# Altium project Oil-Diffuser-A-v1.0.0.PrjPcb
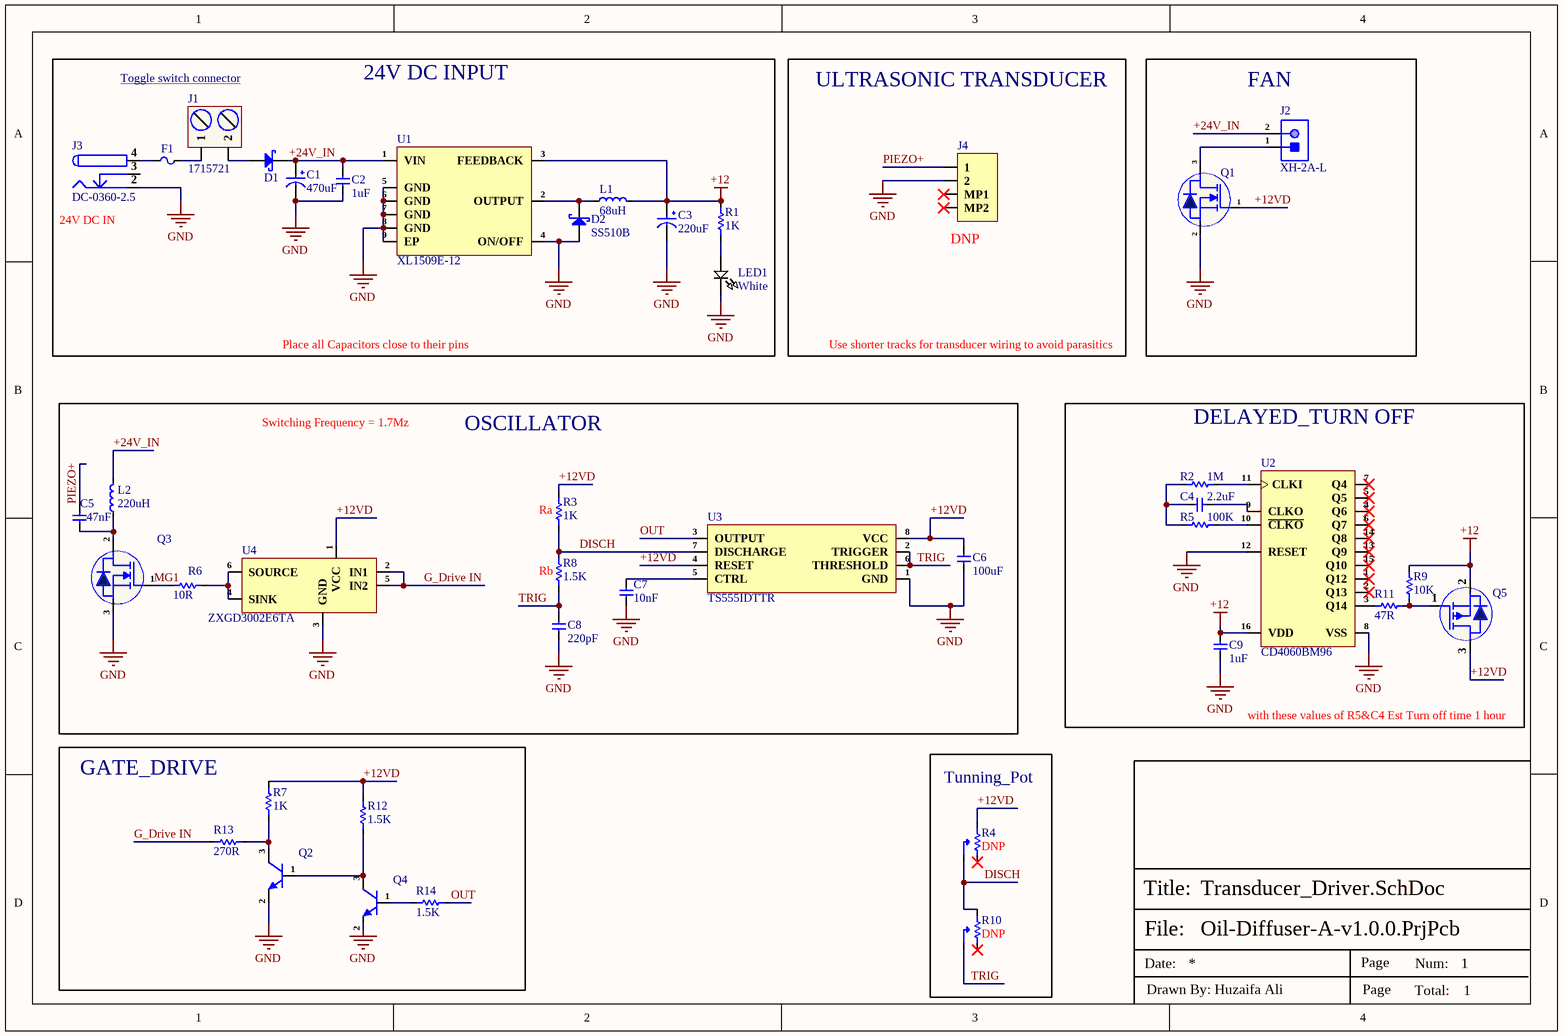
[diagram p0: Transducer_Driver.SchDoc]
1 sheet, 42 parts. Net scope: global (net labels, ports and power ports of the same name join across sheets).
Board file: PCB-Oil Diffuser.PcbDoc

## Sheet Transducer_Driver.SchDoc
size A4; SheetNumber: 1; SheetTotal: 1

### Parts
C1  470uF  [189RV0027]
C2  1uF  [Cap-0603]
C3  220uF  [189RV0019]
C4  2.2uF  [CAP-0603]
C5  47nF  [CFA2J473JC4PK5136A00]
C6  100uF  [Cap-1210]
C7  10nF  [Cap-0603]
C8  220pF  [CD1H221JC9BECHE100]
C9  1uF  [Cap-0603]
D1  SS510B  [SMB_]  (value not drawn)
D2  SS510B  [SMB_]
F1  BSMD1812-150-33V  [Fuse-1812_]  (value not drawn)
J1  1715721  [1715721]
J2  XH-2A-L  [XH-2A-L]
J3  DC-0360-2.5  [DC-0360-2.5]
J4  DNP  [WAFER-PH2.0-2PWB]
L1  68uH  [PSPMAA0605H-680M-IGF]
L2  220uH  [PK0810-221MB]
LED1  White  [LED-0603]
Q1  AO3400A  [sot-23]  (value not drawn)
Q2  ZXTN2040FTA  [SOT-23]  (value not drawn)
Q3  STD12N10L-VB  [TO-252-2L]  (value not drawn)
Q4  ZXTN2040FTA  [SOT-23]  (value not drawn)
Q5  G7P03L  [SOT-23-3L_]  (value not drawn)
R1  1K  [RES-0805]
R2  1M  [Res-0603]
R3  1K  [Plugin,D2.3xL6.5mm]
R4  DNP  [3296W-1-502]
R5  100K  [RES-0805]
R6  10R  [RES-2010]
R7  1K  [Res-1206]
R8  1.5K  [Plugin,D2.3xL6.5mm]
R9  10K  [Res-0603]
R10  DNP  [3296W-1-502]
R11  47R  [Res-0603]
R12  1.5K  [Res-0603]
R13  270R  [Res-0603]
R14  1.5K  [Res-0603]
U1  XL1509E-12  [ESOP-8]
U2  CD4060BM96  [16-SOIC (0.154", 3.90mm Width)]
U3  TS555IDTTR  [SOIC-8(0.154", 3.90mm Width)]
U4  ZXGD3002E6TA  [SOT-23-6]

### Blocks framed on the sheet
24V DC INPUT: C1-C3 D1 D2 F1 J1 J3 L1 LED1 R1 U1
ULTRASONIC TRANSDUCER: J4
FAN: J2 Q1
OSCILLATOR: C5-C8 L2 Q3 R3 R6 R8 U3 U4
DELAYED_TURN OFF: C4 C9 Q5 R2 R5 R9 R11 U2
GATE_DRIVE: Q2 Q4 R7 R12-R14
Tunning_Pot: R4 R10

### Nets
+12: C3.1 C9.2 L1.2 Q5.2(S) R1.2 R9.2 U1.3(FEEDBACK) U2.16(VDD)
GND: C1.2 C2.1 C3.2 C6.1 C7.1 C8.1 C9.1 D2.1(A) J3.2 J4.2 LED1.2 Q1.2(S) Q2.2(E) Q3.3(S) Q4.2(E) U1.4(ON/OFF) U1.5(GND) U1.6(GND) U1.7(GND) U1.8(GND) U1.9(EP) U2.8(VSS) U2.12(RESET) U3.1(GND) U4.3(GND)
+12VD: C6.2 Q1.1(G) Q5.3(D) R3.2 R4.3(CW) R7.2 R12.2 U3.4(RESET) U3.8(VCC) U4.1(VCC)
+24V_IN: C1.1 C2.2 D1.2(K) J2.2 L2.2 U1.1(VIN)
DISCH: R3.1 R4.2(Wiper) R8.2 R10.3(CW) U3.7(DISCHARGE)
G_Drive IN: R13.1 U4.2(IN1) U4.5(IN2)
MG1: Q3.1(G) R6.1
OUT: R14.1 U3.3(OUTPUT)
PIEZO+: C5.1 J4.1
TRIG: C8.2 R8.1 R10.2(Wiper) U3.2(TRIGGER) U3.6(THRESHOLD)
NetC4_1: C4.1 R2.1 R5.1
NetC4_2: C4.2 U2.9(CLKO)
NetC5_2: C5.2 L2.1 Q3.2(D)
NetC7_2: C7.2 U3.5(CTRL)
NetD1_1: D1.1(A) J1.2
NetD2_2: D2.2(K) L1.1 U1.2(OUTPUT)
NetF1_1: F1.1 J3.4
NetF1_2: F1.2 J1.1
NetJ2_1: J2.1 Q1.3(D)
NetLED1_1: LED1.1 R1.1
NetQ2_1: Q2.1(B) Q4.3(C) R12.1
NetQ2_3: Q2.3(C) R7.1 R13.2
NetQ4_1: Q4.1(B) R14.2
NetQ5_1: Q5.1(G) R9.1 R11.2
NetR2_2: R2.2 U2.11(CLKI)
NetR5_2: R5.2 U2.10(~{CLKO})
NetR6_2: R6.2 U4.4(SINK) U4.6(SOURCE)
NetR11_1: R11.1 U2.3(Q14)

Not connected (* = marked no-connect by the designer): J3 3; J4 MP1* MP2*; R4 1(CCW)*; R10 1(CCW)*; U2 1(Q12)* 2(Q13)* 4(Q6)* 5(Q5)* 6(Q7)* 7(Q4)* 13(Q9)* 14(Q8)* 15(Q10)*

### Notes on the sheet
- Toggle switch connector <https://www.amazon.com/Gardner-Bender-GSW-18-Heavy-Duty-Electrical/dp/B00004WLKC/ref=asc_df_B00004WLKC/>
- (near J3) 24V DC IN
- Place all Capacitors close to their pins
- Use shorter tracks for transducer wiring to avoid parasitics
- Switching Frequency = 1.7Mz
- (near R3) Ra
- (near R8) Rb
- with these values of R5&C4 Est Turn off time 1 hour
- File:
- Title:
- Date:
- Page
- Num:
- Total:
- Drawn By: Huzaifa Ali

### Library data of the parts
C1 = 189RV0027: 470uF 35V 850mA@100KHz 80mΩ@100KHz ±20% SMD,D8xL10.5mm Aluminum Electrolytic Capacitors - SMD ROHS; Manufacturer: KNSCHA; Manufacturer Part Number: 189RV0027; Package: SMD,D8xL10.5mm; LCSC Part Number: C7471889; Item Type: Capacitors; ComponentLink1Description: LCSC; ComponentLink1URL: https://www.lcsc.com/product-detail/Aluminum-Electrolytic-Capacitors-SMD_KNSCHA-189RV0027_C7471889.html
C2 C9 = TCC0603X5R105M250CT: 1uF 25V X5R ±20% 0603 Multilayer Ceramic Capacitors MLCC - SMD/SMT ROHS; Manufacturer: CCTC; LCSC Part Number: C6266891; Manufacturer Part Number: TCC0603X5R105M250CT; Value: 1uF; Item Type: Capacitor; ComponentLink1Description: LCSC; ComponentLink1URL: https://www.lcsc.com/product-detail/Multilayer-Ceramic-Capacitors-MLCC-SMD-SMT_CCTC-TCC0603X5R105M250CT_C6266891.html
C3 = 189RV0019: 220uF 35V 600mA@100KHz 160mΩ@100KHz ±20% SMD,D6.3xL7.7mm Aluminum Electrolytic Capacitors - SMD ROHS; Manufacturer: KNSCHA; Manufacturer Part Number: 189RV0019; Package: SMD,D6.3xL7.7mm; LCSC Part Number: C7471881; Item Type: Capacitors; ComponentLink1Description: LCSC; ComponentLink1URL: https://www.lcsc.com/product-detail/Aluminum-Electrolytic-Capacitors-SMD_KNSCHA-189RV0019_C7471881.html
C4 = CC0603KRX5R8BB225: CAP CER 2.2UF 25V X5R 0603; Manufacturer: Yageo; Tolerance: 10%; Item Type: Capacitor; Supplier 1: Digi-Key; Manufacturer Part Number: CC0603KRX5R8BB225; Stock 1: 687936; Pricing 1: 1=0.4, 10=0.276, 50=0.1932, 100=0.1656, 500=0.1242, 1000=0.10488 (USD); Mount: Surface Mount; Case/Package: 0603; Case Code (Metric): 1608; Case Code (Imperial): 0603; Weight: 7.1E-05oz; Min Operating Temperature: -55°C; Max Operating Temperature: 85°C; Packaging: Tape and Reel; Capacitance: 2.2uF; Dielectric: X5R; Voltage Rating: 25V; Termination: SMD/SMT; Resistor Type: Ceramic; Voltage Rating (DC): 25V; Package Quantity: 4000; Length: 1.6mm; Width: 0.031inch; Thickness: 0.037inch; Depth: 0.8mm; Radiation Hardening: No; Lead Free: Lead Free; Halogen Free: Halogen Free; RoHS Compliant: Yes; ComponentLink1URL: https://www.verical.com/server-webapp/html/getDatasheet?partID=782757&src-supplier=Verical; ComponentLink1Description: https://www.verical.com/server-webapp/html/getDatasheet?partID=782757&src-supplier=Verical; Supplier Part Number 1: 311-1786-1-ND; LCSC Part Number: C309478
C5 = CFA2J473JC4PK5136A00: 5% 630V 47nF Plugin,P=5.08mm Film Capacitors ROHS; Manufacturer: Dersonic; Manufacturer Part Number: CFA2J473JC4PK5136A00; Package: Plugin,P=5.08mm; LCSC Part Number: C20754717; Item Type: Capacitor; ComponentLink1Description: LCSC; ComponentLink1URL: https://www.lcsc.com/product-detail/Film-Capacitors_Dersonic-CFA2J473JC4PK5136A00_C20754717.html
C6 = EMK325ABJ107MM-P: CAP CER 100UF 16V X5R 1210; Manufacturer: Taiyo Yuden; Tolerance: 20%; Item Type: Capacitor; Supplier 1: Digi-Key; Manufacturer Part Number: EMK325ABJ107MM-P; RoHS: Yes; Category: Ceramic Capacitors; Stock 1: 81344; Pricing 1: 1=1.75, 10=1.415, 50=1.2352, 100=1.0809, 500=0.82352 (USD); Mounting Technology: Surface Mount; Case/Package: 1210; Case Code (Imperial): 1210; Case Code (Metric): 3225; Min Operating Temperature: -55°C; Max Operating Temperature: 85°C; Packaging: Cut Tape; Value: 100uF; Voltage Rating: 16V; Series: M; Lead Free: Lead Free; RoHS Compliant: Yes; ComponentLink1URL: http://ds.yuden.co.jp/TYCOMPAS/ut/detail.do?productNo=EMK325ABJ107MM-P&fileName=EMK325ABJ107MM-P_SS&mode=specSheetDownload&src-supplier=Digi-Key; ComponentLink1Description: http://ds.yuden.co.jp/TYCOMPAS/ut/detail.do?productNo=EMK325ABJ107MM-P&fileName=EMK325ABJ107MM-P_SS&mode=specSheetDownload&src-supplier=Digi-Key; Supplier Part Number 1: 587-5426-1-ND; LCSC Part Number: C90143
C7 = GCM188R91H103KA37D: CAP CER 10000PF 50V X8R 0603; Item Type: Capacitor; Tolerance: 10%; LCSC Part Number: C710687; ComponentLink1Description: LCSC; Supplier: Avnet; Supplier Part Number: GCM188R91H103KA37D; RoHS: Yes; Category: Ceramic Capacitors; Stock: 20000; Pricing: 4000=0.01955, 8000=0.01909, 16000=0.01863, 24000=0.01817, 32000=0.01771 (USD); Case/Package: 0603; Min Operating Temperature: -55°C; Max Operating Temperature: 150°C; Value: 10nF; Series: GCM; Voltage Rating: 50V; Ratings: AEC-Q200; Lead Free: Lead Free; RoHS Compliant: Yes; ComponentLink2URL: http://search.murata.co.jp/Ceramy/image/img/A01X/partnumbering_e_02.pdf?src-supplier=Digi-Key; ComponentLink2Description: http://search.murata.co.jp/Ceramy/image/img/A01X/partnumbering_e_02.pdf?src-supplier=Digi-Key
C8 = CD1H221JC9BECHE100: ±5% 50V 220pF NP0 Plugin,P=5.08mm Multilayer Ceramic Capacitors MLCC - Leaded ROHS; Manufacturer: Dersonic; Manufacturer Part Number: CD1H221JC9BECHE100; Package: Plugin,P=5.08mm; LCSC Part Number: C2761745; Item Type: Capacitors; ComponentLink1Description: LCSC; ComponentLink1URL: https://www.lcsc.com/product-detail/Multilayer-Ceramic-Capacitors-MLCC-Leaded_Dersonic-CD1H221JC9BECHE100_C2761745.html
D1 D2 = SS510B: SCHOTTKY DIODE SMB 100V 5A; Manufacturer: MDD; Manufacturer Part Number: SS510B; Package: SMB; ComponentLink1Description: LCSC; ComponentLink1URL: https://www.lcsc.com/product-detail/Schottky-Barrier-Diodes-SBD_JUXING-SS510B_C3011128.html; LCSC Part Number: C3011128; Item Type: Diode
F1 = BSMD1812-150-33V: 33V 1.5A 40A 3A 1812 Resettable Fuses ROHS; Manufacturer: BHFUSE; Item Type: Fuse; Manufacturer Part Number: BSMD1812-150-33V; Package: 1812; LCSC Part Number: C883154; ComponentLink1Description: LCSC; ComponentLink1URL: https://www.lcsc.com/product-detail/Resettable-Fuses_BHFUSE-BSMD1812-150-33V_C883154.html
J1 = 1715721: TERM BLK 2P SIDE ENT 5.08MM PCB; Manufacturer: Phoenix Contact; Item Type: Terminal Blocks; Supplier: Digikey; LCSC Part Number: C480516; Manufacturer Part Number: 1715721; RoHS: Yes; Stock: 13160; Pricing: 1=0.94 (USD); ComponentLink1URL: https://datasheet.ciiva.com/1120/1697161-1120393.pdf?src-supplier=Farnell; ComponentLink1Description: https://datasheet.ciiva.com/1120/1697161-1120393.pdf?src-supplier=Farnell; ComponentLink2URL: https://datasheet.ciiva.com/832/1715721-832095.pdf?src-supplier=Digikey; ComponentLink2Description: https://datasheet.ciiva.com/832/1715721-832095.pdf?src-supplier=Digikey; ComponentLink3URL: https://datasheet.ciiva.com/15169/getdatasheetpartid-212174-15169929.pdf?src-supplier=Verical; ComponentLink3Description: https://datasheet.ciiva.com/15169/getdatasheetpartid-212174-15169929.pdf?src-supplier=Verical; ComponentLink4URL: https://datasheet.ciiva.com/16046/1715721-16046034.pdf?src-supplier=Onlinecomponents.com; ComponentLink4Description: https://datasheet.ciiva.com/16046/1715721-16046034.pdf?src-supplier=Onlinecomponents.com
J2 = XH-2A-L: 1x2P 2P XH 1 Tin 2.5mm 2 -25℃~+85℃ Brass 3A Straight Plugin,P=2.5mm Wire To Board Connector ROHS; Manufacturer: HCTL; Manufacturer Part Number: XH-2A-L; Package: Plugin,P=2.5mm; LCSC Part Number: C2908597; Item Type: Wire To Board Connector; ComponentLink1Description: LCSC; ComponentLink1URL: https://www.lcsc.com/product-detail/Wire-To-Board-Connector_HCTL-XH-2A-L_C2908597.html
J3 = DC-0360-2.5: DC Power Receptacle 260℃ Brass -20℃~+70℃ 2.5mm 6mm 2.5A 24V Plugin AC/DC Power Connectors ROHS; Manufacturer: XKB Connectivity; Item Type: DC Jack; Manufacturer Part Number: DC-0360-2.5; Package: Plugin; LCSC Part Number: C319122; ComponentLink1Description: LCSC; ComponentLink1URL: https://www.lcsc.com/product-detail/AC-DC-Power-Connectors_XKB-Connectivity-DC-0360-2-5_C319122.html
J4 = WAFER-PH2.0-2PWB: 1x2P 1 2mm Male pin 2 -25℃~+85℃ 2A Surface Mount SMD,P=2mm Wire To Board / Wire To Wire Connector ROHS; Manufacturer: XUNPU; Item Type: Right Angle JST; Manufacturer Part Number: WAFER-PH2.0-2PWB; Package: SMD,P=2mm; LCSC Part Number: C3029440; ComponentLink1Description: LCSC; ComponentLink1URL: https://www.lcsc.com/product-detail/Wire-To-Board-Wire-To-Wire-Connector_XUNPU-WAFER-PH2-0-2PWB_C3029440.html
L1 = PSPMAA0605H-680M-IGF: 2A 68uH ±20% 2.5A SMD,6.6x7.1mm Power Inductors ROHS; Manufacturer: PROD Tech; Manufacturer Part Number: PSPMAA0605H-680M-IGF; Package: SMD,6.6x7.1mm; LCSC Part Number: C2983094; Item Type: Inductor; ComponentLink1Description: LCSC; ComponentLink1URL: https://www.lcsc.com/product-detail/Power-Inductors_PROD-Tech-PSPMAA0605H-680M-IGF_C2983094.html
L2 = PK0810-221MB: 600mA 220uH EI-core Inductor ±20% Plugin Power Inductors ROHS; Manufacturer: SXN; Manufacturer Part Number: PK0810-221MB; Package: Plugin; LCSC Part Number: C400317; Item Type: Inductor; ComponentLink1Description: LCSC; ComponentLink1URL: https://www.lcsc.com/product-detail/Power-Inductors_SXN-Shun-Xiang-Nuo-Elec-PK0810-221MB_C400317.html
LED1 = NCD0603W3: White light 0603 Light Emitting Diodes (LED) ROHS; Manufacturer: Foshan NationStar Optoelectronics; Manufacturer Part Number: NCD0603W3; Package: 0603; LCSC Part Number: C158100; Item Type: LED; ComponentLink1Description: LCSC; ComponentLink1URL: https://www.lcsc.com/product-detail/Light-Emitting-Diodes-LED_Foshan-NationStar-Optoelectronics-NCD0603W3_C158100.html
Q1 = AO3400A: 30V 5.8A 32mΩ@10V,5.8A 1.4W 1.4V@250uA N Channel SOT-23 MOSFETs ROHS; Manufacturer: BORN; Item Type: Mosfet; ComponentLink1Description: LCSC; ComponentLink1URL: https://www.lcsc.com/product-detail/MOSFETs_BORN-AO3400A_C344010.html; Manufacturer Part Number: AO3400A; Footprint: SOT-23; LCSC Part Number: C344010
Q2 Q4 = ZXTN2040FTA: TRANS NPN 40V 1A SOT23-3; Manufacturer: Diodes Zetex; Item Type: BJTs; Supplier: Digikey; LCSC Part Number: C460141; Manufacturer Part Number: ZXTN2040FTA; RoHS: Yes; Stock: 9989; Pricing: 1=0.38, 10=0.258, 100=0.1744, 500=0.13526, 1000=0.12224 (USD); ComponentLink1URL: https://datasheet.ciiva.com/973/zxtn2040f-973922.pdf?src-supplier=Digikey; ComponentLink1Description: https://datasheet.ciiva.com/973/zxtn2040f-973922.pdf?src-supplier=Digikey; ComponentLink2URL: https://datasheet.ciiva.com/17037/0900766b80d2efd3-17037010.pdf?src-supplier=Allied+Electronics; ComponentLink2Description: https://datasheet.ciiva.com/17037/0900766b80d2efd3-17037010.pdf?src-supplier=Allied+Electronics; ComponentLink3URL: https://datasheet.ciiva.com/15139/getdatasheetpartid-76608-15139038.pdf?src-supplier=Verical; ComponentLink3Description: https://datasheet.ciiva.com/15139/getdatasheetpartid-76608-15139038.pdf?src-supplier=Verical; ComponentLink4URL: https://datasheet.ciiva.com/973/zxtn2040f-973923.pdf?src-supplier=Digikey; ComponentLink4Description: https://datasheet.ciiva.com/973/zxtn2040f-973923.pdf?src-supplier=Digikey; ComponentLink5URL: https://datasheet.ciiva.com/973/zxtn2040f-973924.pdf?src-supplier=Digikey; ComponentLink5Description: https://datasheet.ciiva.com/973/zxtn2040f-973924.pdf?src-supplier=Digikey; ComponentLink6URL: https://datasheet.ciiva.com/11201/zxtn2040f-11201581.pdf?src-supplier=Avnet; ComponentLink6Description: https://datasheet.ciiva.com/11201/zxtn2040f-11201581.pdf?src-supplier=Avnet; ComponentLink7URL: https://datasheet.ciiva.com/11206/zxtn2040f-11206668.pdf?src-supplier=Avnet; ComponentLink7Description: https://datasheet.ciiva.com/11206/zxtn2040f-11206668.pdf?src-supplier=Avnet; ComponentLink8URL: https://datasheet.ciiva.com/16508/zxtn2040f-16508997.pdf?src-supplier=Future+Electronics; ComponentLink8Description: https://datasheet.ciiva.com/16508/zxtn2040f-16508997.pdf?src-supplier=Future+Electronics
Q3 = STD12N10L-VB: 100V 15A 96W 114mΩ@10V,3A 3.5V@250uA 1 N-Channel TO-252 MOSFETs ROHS; Manufacturer: VBsemi; Manufacturer Part Number: STD12N10L-VB; Package: TO-252; LCSC Part Number: C5179533; Item Type: MOSFETs; ComponentLink1Description: LCSC; ComponentLink1URL: https://www.lcsc.com/product-detail/MOSFETs_VBsemi-Elec-STD12N10L-VB_C5179533.html
Q5 = G7P03L: 30V 7A 19mΩ 1.9W 1.1V@250uA P Channel SOT-23-3L MOSFETs ROHS; Manufacturer: GoFord; Item Type: Mosfet; Supplier 1: Digi-Key; Manufacturer Part Number: G7P03L; RoHS: No; Category: Uncategorized; Stock 1: 6672; Pricing 1: 1=0.45000, 10=0.36500, 100=0.24860, 500=0.18648, 1000=0.13986 (USD); LCSC Part Number: C840062; ComponentLink1Description: LCSC; ComponentLink1URL: https://www.lcsc.com/product-detail/MOSFETs_GOFORD-G7P03L_C840062.html
R1 = RC0805FR-071KL: RES 1K OHM 1% 1/8W 0805; Manufacturer: Yageo; Value: 1kR; Voltage Rating (DC): 150V; Temperature Coefficient: 100ppm/°C; Power Rating: 125mW; Item Type: Resistor; Supplier: Future Electronics; Supplier Part Number: 8126013; Manufacturer Part Number: RC0805FR-071KL; RoHS: Yes; Category: Chip SMD Resistors; Stock: 8305000; Pricing: 5000=0.117, 25000=0.112, 125000=0.107, 500000=0.104, 1250000=0.0981 (USD); Case/Package: 0805; Pins: 2; Case Code (Metric): 2012; Case Code (Imperial): 0805; Min Operating Temperature: -55°C; Max Operating Temperature: 155°C; Tolerance: 1%; Packaging: Tape and Reel; Resistor Type: Thick Film; Package Quantity: 1; Voltage Rating: 150V; Termination: SMD/SMT; Series: RC; Number of Terminations: 2; Max Power Dissipation: 125mW; Features: Moisture Resistant; Resistance Tolerance: 1%; Construction: Rectangular; Voltage Rating (AC): 150V; Length: 0.079inch; Width: 0.049inch; Height: 0.024inch; Depth: 1.25mm; Reach SVHC Compliant: No; Lead Free: 5697LeadFree; RoHS Compliant: Yes; Military Standard: Not; ComponentLink1URL: https://datasheet.ciiva.com/7941/1686128-7941719.pdf?src-supplier=Element14; ComponentLink1Description: https://datasheet.ciiva.com/7941/1686128-7941719.pdf?src-supplier=Element14; ComponentLink2URL: https://datasheet.ciiva.com/46385/444164-46385020.pdf?src-supplier=Element14; ComponentLink2Description: https://datasheet.ciiva.com/46385/444164-46385020.pdf?src-supplier=Element14; ComponentLink3URL: https://datasheet.ciiva.com/2456/pyu-r-int-thick-7-2456976.pdf?src-supplier=Digi-Key; ComponentLink3Description: https://datasheet.ciiva.com/2456/pyu-r-int-thick-7-2456976.pdf?src-supplier=Digi-Key; ComponentLink4URL: https://datasheet.ciiva.com/2456/pyu-r-int-thick-7-2456977.pdf?src-supplier=Digi-Key; ComponentLink4Description: https://datasheet.ciiva.com/2456/pyu-r-int-thick-7-2456977.pdf?src-supplier=Digi-Key; ComponentLink5URL: https://datasheet.ciiva.com/2456/pyu-r-int-thick-7-2456975.pdf?src-supplier=Digi-Key; ComponentLink5Description: https://datasheet.ciiva.com/2456/pyu-r-int-thick-7-2456975.pdf?src-supplier=Digi-Key; ComponentLink6URL: https://datasheet.ciiva.com/16850/rc0805-16850409.pdf?src-supplier=Future+Electronics; ComponentLink6Description: https://datasheet.ciiva.com/16850/rc0805-16850409.pdf?src-supplier=Future+Electronics; LCSC Part Number: C95781
R2 = CRCW06031M00FKEA: RES SMD 1M OHM 1% 1/10W 0603; Manufacturer: Vishay; Item Type: Resistors; Value: 1MR; Temperature Coefficient: 100ppm/°C; Power Rating: 100mW; Voltage Rating: 75V; Supplier: Digikey; LCSC Part Number: C844922; Manufacturer Part Number: CRCW06031M00FKEA; RoHS: Yes; Stock: 380955; Pricing: 1=0.1, 10=0.027, 50=0.0166, 100=0.0138, 500=0.00934, 1000=0.00802 (USD); Case/Package: 0603; Pins: 2; Contact Plating: Tin; Weight: 7.1E-05oz; Case Code (Imperial): 0603; Case Code (Metric): 1608; Min Operating Temperature: -55°C; Max Operating Temperature: 155°C; Tolerance: 1%; Packaging: Tape and Reel; Resistor Type: Thick Film; Package Quantity: 10; Termination: SMD/SMT; Series: CRCW; Number of Terminations: 2; Max Power Dissipation: 100mW; Features: Automotive AEC-Q200; Technology: THICK FILM; Voltage Rating (DC): 75V; Construction: Rectangular; Resistance Tolerance: 1%; Length: 1.55mm; Width: 0.033inch; Height: 0.45mm; Depth: 0.85mm; Radiation Hardening: No; RoHS Compliant: Yes; Lead Free: 5697LeadFree; Reach SVHC Compliant: Unknown; Military Standard: Not; ComponentLink1URL: https://datasheet.ciiva.com/11809/0900766b80d98afc-11809074.pdf?src-supplier=Rs; ComponentLink1Description: https://datasheet.ciiva.com/11809/0900766b80d98afc-11809074.pdf?src-supplier=Rs; ComponentLink2URL: https://datasheet.ciiva.com/7841/125364-7841823.pdf?src-supplier=Element14; ComponentLink2Description: https://datasheet.ciiva.com/7841/125364-7841823.pdf?src-supplier=Element14; ComponentLink3URL: https://datasheet.ciiva.com/7841/1720486-7841822.pdf?src-supplier=Element14; ComponentLink3Description: https://datasheet.ciiva.com/7841/1720486-7841822.pdf?src-supplier=Element14; ComponentLink4URL: https://datasheet.ciiva.com/26314/fld-crcw-e3-data-en-26314645.pdf?src-supplier=Distrelec; ComponentLink4Description: https://datasheet.ciiva.com/26314/fld-crcw-e3-data-en-26314645.pdf?src-supplier=Distrelec; ComponentLink5URL: https://datasheet.ciiva.com/2465/dcrcwe3-2465550.pdf?src-supplier=Digikey; ComponentLink5Description: https://datasheet.ciiva.com/2465/dcrcwe3-2465550.pdf?src-supplier=Digikey; ComponentLink6URL: https://datasheet.ciiva.com/2465/dcrcwe3-2465551.pdf?src-supplier=Digikey; ComponentLink6Description: https://datasheet.ciiva.com/2465/dcrcwe3-2465551.pdf?src-supplier=Digikey; ComponentLink7URL: https://datasheet.ciiva.com/2465/dcrcwe3-2465549.pdf?src-supplier=Digikey; ComponentLink7Description: https://datasheet.ciiva.com/2465/dcrcwe3-2465549.pdf?src-supplier=Digikey; ComponentLink8URL: https://datasheet.ciiva.com/16311/dcrcwe3-16311533.pdf?src-supplier=Future+Electronics; ComponentLink8Description: https://datasheet.ciiva.com/16311/dcrcwe3-16311533.pdf?src-supplier=Future+Electronics
R3 = MF14W 1KR: Metal Film Resistors 1kΩ 250mW ±200ppm/℃ ±1% Plugin,D2.3xL6.5mm Through Hole Resistors ROHS; Manufacturer: Huaxing Mechanical-Elec; Manufacturer Part Number: MF1/4W-1KΩ±1%T52; Package: Plugin,D2.3xL6.5mm; LCSC Part Number: C713997; Item Type: Resistors; ComponentLink1Description: LCSC; ComponentLink1URL: https://www.lcsc.com/product-detail/Through-Hole-Resistors_Huaxing-Mechanical-Elec-MF1-4W-1K-1-T52_C713997.html
R4 R10 = 3296W-1-502: 10% 5kΩ Plugin Potentiometers, Variable Resistors ROHS; Manufacturer: BOCHEN; Manufacturer Part Number: 3296W-1-502; LCSC Part Number: C118907; Item Type: Potentiometer; ComponentLink1Description: LCSC; ComponentLink1URL: https://www.lcsc.com/product-detail/Potentiometers-Variable-Resistors_BOCHEN-Chengdu-Guosheng-Tech-3296W-1-502_C118907.html
R5 = RC0805FR-07100KL: RES 100K OHM 1% 1/8W 0805; Manufacturer: Yageo; Resistance: 100kR; Power Rating: 125mW; Voltage Rating (DC): 150V; Temperature Coefficient: 100ppm/°C; Item Type: Resistor; Supplier 1: Avnet; Manufacturer Part Number: RC0805FR-07100KL; RoHS: Yes; Category: Chip SMD Resistors; Stock 1: 695000; Pricing 1: 5000=0.00227, 10000=0.00224, 20000=0.00217 (USD); Case/Package: 0805; Number of Pins: 2; Case Code (Metric): 2012; Case Code (Imperial): 0805; Size Code: 0805; Min Operating Temperature: -55°C; Max Operating Temperature: 155°C; Resistor Type: Thick Film; Tolerance: 1%; Packaging: Tape and Reel; Voltage Rating: 150V; Package Quantity: 1; Number of Terminations: 2; Termination: SMD/SMT; Max Power Dissipation: 125mW; Features: Moisture Resistant; Series: RC; Construction: Rectangular; Resistance Tolerance: 1%; Technology: THICK FILM; Length: 0.079inch; Width: 0.049inch; Height: 0.024inch; Depth: 1.25mm; Lead Pitch: 0.4mm; Lead Free: Lead Free; RoHS Compliant: Yes; Military Standard: Not; ComponentLink1URL: https://datasheet.ciiva.com/11808/0900766b8106beab-11808858.pdf?src-supplier=RSComponents; ComponentLink1Description: https://datasheet.ciiva.com/11808/0900766b8106beab-11808858.pdf?src-supplier=RSComponents; ComponentLink2URL: https://datasheet.ciiva.com/7941/1686128-7941677.pdf?src-supplier=Element14; ComponentLink2Description: https://datasheet.ciiva.com/7941/1686128-7941677.pdf?src-supplier=Element14; ComponentLink3URL: https://datasheet.ciiva.com/7660/38627-7660796.pdf?src-supplier=Element14; ComponentLink3Description: https://datasheet.ciiva.com/7660/38627-7660796.pdf?src-supplier=Element14; ComponentLink4URL: https://datasheet.ciiva.com/22747/444164-22747534.pdf?src-supplier=Element14; ComponentLink4Description: https://datasheet.ciiva.com/22747/444164-22747534.pdf?src-supplier=Element14; ComponentLink5URL: https://datasheet.ciiva.com/2457/pyu-r-int-thick-7-2457018.pdf?src-supplier=Digi-Key; ComponentLink5Description: https://datasheet.ciiva.com/2457/pyu-r-int-thick-7-2457018.pdf?src-supplier=Digi-Key; ComponentLink6URL: https://datasheet.ciiva.com/2457/pyu-r-int-thick-7-2457019.pdf?src-supplier=Digi-Key; ComponentLink6Description: https://datasheet.ciiva.com/2457/pyu-r-int-thick-7-2457019.pdf?src-supplier=Digi-Key; ComponentLink7URL: https://datasheet.ciiva.com/2457/pyu-r-int-thick-7-2457017.pdf?src-supplier=Digi-Key; ComponentLink7Description: https://datasheet.ciiva.com/2457/pyu-r-int-thick-7-2457017.pdf?src-supplier=Digi-Key; ComponentLink8URL: https://datasheet.ciiva.com/12667/rc0805-12667001.pdf?src-supplier=Mouser; ComponentLink8Description: https://datasheet.ciiva.com/12667/rc0805-12667001.pdf?src-supplier=Mouser; ComponentLink9URL: https://datasheet.ciiva.com/7941/1697719-7941676.pdf?src-supplier=Element14; ComponentLink9Description: https://datasheet.ciiva.com/7941/1697719-7941676.pdf?src-supplier=Element14; ComponentLink10URL: https://datasheet.ciiva.com/7941/1697719-7941678.pdf?src-supplier=Element14; ComponentLink10Description: https://datasheet.ciiva.com/7941/1697719-7941678.pdf?src-supplier=Element14; ComponentLink11URL: https://datasheet.ciiva.com/16747/rc0805-16747226.pdf?src-supplier=Future+Electronics; ComponentLink11Description: https://datasheet.ciiva.com/16747/rc0805-16747226.pdf?src-supplier=Future+Electronics; Supplier Part Number 1: RC0805FR-07100KL; LCSC Part Number: C96346
R6 = RC2010FK-0710RL: RES 10 OHM 1% 3/4W 2010; Manufacturer: Yageo; Item Type: Resistors; Supplier: Future Electronics; LCSC Part Number: C137067; Manufacturer Part Number: RC2010FK-0710RL; RoHS: Yes; Stock: 8000; Pricing: 4000=0.041, 12000=0.0395, 20000=0.0388, 60000=0.0374, 100000=0.0362 (USD); ComponentLink1URL: https://datasheet.ciiva.com/12667/pyu-rc2010-51-rohs-l-4-12667047.pdf?src-supplier=Mouser; ComponentLink1Description: https://datasheet.ciiva.com/12667/pyu-rc2010-51-rohs-l-4-12667047.pdf?src-supplier=Mouser; ComponentLink2URL: https://datasheet.ciiva.com/7672/1563630-7672315.pdf?src-supplier=Element14; ComponentLink2Description: https://datasheet.ciiva.com/7672/1563630-7672315.pdf?src-supplier=Element14; ComponentLink3URL: https://datasheet.ciiva.com/7672/1563630-7672316.pdf?src-supplier=Element14; ComponentLink3Description: https://datasheet.ciiva.com/7672/1563630-7672316.pdf?src-supplier=Element14; ComponentLink4URL: https://datasheet.ciiva.com/17422/pyu-rc2010-51-rohs-l-4-17422060.pdf?src-supplier=Future+Electronics; ComponentLink4Description: https://datasheet.ciiva.com/17422/pyu-rc2010-51-rohs-l-4-17422060.pdf?src-supplier=Future+Electronics
R7 = RC1206FR-7W1KL: RES 1K OHM 1% 1/2W 1206; Manufacturer: Yageo; Item Type: Resistor; Supplier 1: Digi-Key; Manufacturer Part Number: RC1206FR-7W1KL; RoHS: Yes; Category: Chip SMD Resistors; Stock 1: 6215; Pricing 1: 1=0.19000, 10=0.15700, 100=0.06150, 1000=0.02572, 2500=0.02358 (USD); RoHS Compliant: Yes; Supplier Part Number 1: 13-RC1206FR-7W1KLCT-ND; LCSC Part Number: C859155; ComponentLink1Description: LCSC; ComponentLink1URL: https://www.lcsc.com/product-detail/Chip-Resistor-Surface-Mount_YAGEO-RC1206FR-7W1KL_C859155.html
R8 = MF14W 1.5KR: Metal Film Resistors 1.5kΩ 250mW ±100ppm/℃ ±1% Plugin,D2.3xL6.5mm Through Hole Resistors ROHS; Manufacturer: CCO; Manufacturer Part Number: MF1/4W-1.5KΩ±1% T; Package: Plugin,D2.3xL6.5mm; LCSC Part Number: C119328; Item Type: Resistors; ComponentLink1Description: LCSC; ComponentLink1URL: https://www.lcsc.com/product-detail/Through-Hole-Resistors_CCO-Chian-Chia-Elec-MF1-4W-1-5K-1-T_C119328.html
R9 = RT0603BRD0710KL: RES SMD 10K OHM 0.1% 1/10W 0603; Manufacturer: Yageo; Power: 100mW; Rated Temperature: 70°C; Value: 10kR; Temperature Coefficient: 25ppm/°C; Working Voltage: 75V; Package Height: 0.45mm; Package Length: 1.6mm; Package Width: 0.8mm; Item Type: Resistor; Supplier 1: Rs; Manufacturer Part Number: RT0603BRD0710KL; RoHS: Yes; Category: Chip SMD Resistors; Stock 1: 20510; Pricing 1: 100=0.29800, 250=0.27800, 500=0.25900, 1000=0.23700 (GBP); Mounting Technology: Surface Mount; Pins: 2; Case/Package: 0603; Min Operating Temperature: -55°C; Max Operating Temperature: 155°C; Tolerance: 0.1%; Resistor Type: FIXED RESISTOR; Construction: Chip; Package Style: SMTMeter; Packaging: Tape and Reel; Technology: THIN FILM; Termination: Wraparound; Reach SVHC Compliant: Yes; RoHS Compliant: Yes; ComponentLink1URL: https://datasheet.ciiva.com:443/pdfs/VipMasterIC/IC/YAGO/YAGO-S-A0008510989/YAGO-S-A0008510989-1.pdf?src-supplier=IHS+Markit; ComponentLink1Description: https://datasheet.ciiva.com:443/pdfs/VipMasterIC/IC/YAGO/YAGO-S-A0008510989/YAGO-S-A0008510989-1.pdf?src-supplier=IHS+Markit; ComponentLink2URL: https://datasheet.ciiva.com/5624/pyu-rt-1-to-0-05-rohs-l-4-5624351.pdf?src-supplier=Mouser; ComponentLink2Description: https://datasheet.ciiva.com/5624/pyu-rt-1-to-0-05-rohs-l-4-5624351.pdf?src-supplier=Mouser; ComponentLink3URL: https://datasheet.ciiva.com/29721/pyu-rt-1-to-0-05-rohs-l-4-29721177.pdf?src-supplier=Digi-Key; ComponentLink3Description: https://datasheet.ciiva.com/29721/pyu-rt-1-to-0-05-rohs-l-4-29721177.pdf?src-supplier=Digi-Key; Supplier Part Number 1: 1991391P; LCSC Part Number: C95204
R11 = RC0603FR-0747RL: RES SMD 47OHM 0.1W 0603; Manufacturer: Yageo; Tolerance: 1%; Power Rating: 100mW; Voltage Rating (DC): 50V; Temperature Coefficient: 100ppm/°C; Voltage Rating: 75V; Supplier 1: Digi-Key; Manufacturer Part Number: RC0603FR-0747RL; RoHS: Yes; Category: Chip SMD Resistors; Stock 1: 596562; Pricing 1: 1=0.10000, 10=0.02400, 100=0.00970, 1000=0.00436, 2500=0.00378 (USD); Case/Package: 0603; Number of Pins: 2; Case Code (Imperial): 0603; Case Code (Metric): 1608; Weight: 7.1E-05oz; Size Code: 0603; Min Operating Temperature: -55°C; Max Operating Temperature: 155°C; Resistance: 47R; Packaging: Tape and Reel; Package Quantity: 1; Termination: SMD/SMT; Resistor Type: Thick Film; Number of Terminations: 2; Max Power Dissipation: 100mW; Features: Moisture Resistant; Series: RC; Construction: Rectangular; Resistance Tolerance: 1%; Length: 1.6mm; Width: 0.8mm; Height: 0.022inch; Depth: 0.8mm; REACH SVHC: Unknown; Lead Free: Lead Free; Military Standard: Not; RoHS Compliant: Yes; ComponentLink1URL: https://datasheet.ciiva.com/2453/pyu-r-int-thick-7-2453922.pdf?src-supplier=Digi-Key; ComponentLink1Description: https://datasheet.ciiva.com/2453/pyu-r-int-thick-7-2453922.pdf?src-supplier=Digi-Key; ComponentLink2URL: https://datasheet.ciiva.com/2453/pyu-r-int-thick-7-2453923.pdf?src-supplier=Digi-Key; ComponentLink2Description: https://datasheet.ciiva.com/2453/pyu-r-int-thick-7-2453923.pdf?src-supplier=Digi-Key; ComponentLink3URL: https://datasheet.ciiva.com/2453/pyu-r-int-thick-7-2453924.pdf?src-supplier=Digi-Key; ComponentLink3Description: https://datasheet.ciiva.com/2453/pyu-r-int-thick-7-2453924.pdf?src-supplier=Digi-Key; ComponentLink4URL: https://datasheet.ciiva.com/7746/443971-7746363.pdf?src-supplier=Element14; ComponentLink4Description: https://datasheet.ciiva.com/7746/443971-7746363.pdf?src-supplier=Element14; ComponentLink5URL: https://datasheet.ciiva.com/7746/443971-7746364.pdf?src-supplier=Element14; ComponentLink5Description: https://datasheet.ciiva.com/7746/443971-7746364.pdf?src-supplier=Element14; ComponentLink6URL: https://datasheet.ciiva.com/46440/1868787-46440908.pdf?src-supplier=Element14; ComponentLink6Description: https://datasheet.ciiva.com/46440/1868787-46440908.pdf?src-supplier=Element14; Supplier Part Number 1: 311-47.0HRCT-ND; LCSC Part Number: C114623
R12 R14 = RC0603FR-071K5L: RES 1.5K OHM 1% 1/10W 0603; Manufacturer: Yageo; Voltage Rating (DC): 50V; Resistance: 1.5kR; Temperature Coefficient: 100ppm/°C; Power Rating: 100mW; Item Type: Resistor; Supplier 1: Arrow Electronics; Manufacturer Part Number: RC0603FR-071K5L; RoHS: Yes; Category: Chip SMD Resistors; Stock 1: 15000; Pricing 1: 1=0.00160, 5000=0.00160 (USD); Case/Package: 0603; Number of Pins: 2; Case Code (Metric): 1608; Case Code (Imperial): 0603; Size Code: 0603; Min Operating Temperature: -55°C; Max Operating Temperature: 155°C; Tolerance: 1%; Packaging: Tape and Reel; Resistor Type: Thick Film; Voltage Rating: 50V; Package Quantity: 1; Number of Terminations: 2; Termination: SMD/SMT; Max Power Dissipation: 100mW; Features: Moisture Resistant; Series: RC; Resistance Tolerance: 1%; Construction: Rectangular; Length: 0.063inch; Width: 0.031inch; Height: 0.022inch; Depth: 0.8mm; REACH SVHC: No SVHC; Lead Free: Lead Free; Military Standard: Not; RoHS Compliant: Yes; Supplier Part Number 1: RC0603FR-071K5L; LCSC Part Number: C114668
R13 = RT0603BRE07270RL: RES SMD 270 OHM 0.1% 1/10W 0603; Manufacturer: Yageo; Max Power Dissipation: 100mW; Temperature Coefficient: 50ppm/°C; Voltage Rating (DC): 50V; Item Type: Resistor; Supplier 1: Digi-Key; Manufacturer Part Number: RT0603BRE07270RL; RoHS: Yes; Category: Chip SMD Resistors; Pricing 1: 5000=0.04770 (USD); Case/Package: 0603; Min Operating Temperature: -55°C; Max Operating Temperature: 125°C; Resistance: 270R; Tolerance: 0.1%; Packaging: Tape and Reel; Package Quantity: 5000; Resistor Type: Thin Film; Number of Terminations: 2; Series: RT; Construction: Rectangular; Length: 0.063inch; Width: 0.031inch; Height: 0.022inch; Depth: 0.8mm; Military Standard: Not; Lead Free: Lead Free; RoHS Compliant: Yes; ComponentLink1URL: https://datasheet.ciiva.com/2584/pyu-rt-1-to-0-05-rohs-l-5-2584379.pdf?src-supplier=Digi-Key; ComponentLink1Description: https://datasheet.ciiva.com/2584/pyu-rt-1-to-0-05-rohs-l-5-2584379.pdf?src-supplier=Digi-Key; Supplier Part Number 1: RT0603BRE07270RL-ND; LCSC Part Number: C705836
U1 = XL1509E-12: Step-down type Fixed 12V 2A 4.5V~40V ESOP-8 DC-DC Converters ROHS; Manufacturer: UMW; Item Type: IC; Manufacturer Part Number: XL1509E-12; Package: ESOP-8; LCSC Part Number: C5185875; ComponentLink1Description: LCSC; ComponentLink1URL: https://www.lcsc.com/product-detail/DC-DC-Converters_UMW-Youtai-Semiconductor-Co-Ltd-XL1509E-12_C5185875.html
U2 = CD4060BM96: IC BINARY COUNTER 14-BIT 16SOIC; Manufacturer: Texas Instruments; Supplier: Digikey; LCSC Part Number: C32699; Manufacturer Part Number: CD4060BM96; RoHS: Yes; Item Type: IC; Stock: 25840; Pricing: 1=0.42, 10=0.296, 25=0.264, 100=0.2285, 250=0.2116, 500=0.20144, 1000=0.19306 (USD); ComponentLink1URL: https://datasheet.ciiva.com/26940/getdatasheetpartid-134495-26940293.pdf?src-supplier=Verical; ComponentLink1Description: https://datasheet.ciiva.com/26940/getdatasheetpartid-134495-26940293.pdf?src-supplier=Verical; ComponentLink2URL: https://datasheet.ciiva.com/6623/cd4060b-6623678.pdf?src-supplier=Digikey; ComponentLink2Description: https://datasheet.ciiva.com/6623/cd4060b-6623678.pdf?src-supplier=Digikey; ComponentLink3URL: https://datasheet.ciiva.com/14295/cd4060b-14295847.pdf?src-supplier=Avnet; ComponentLink3Description: https://datasheet.ciiva.com/14295/cd4060b-14295847.pdf?src-supplier=Avnet; ComponentLink4URL: https://datasheet.ciiva.com/41455/001015500-da-01-en-ic-binary-counter-cd4060bm96-soic-16-tid-41455418.pdf?src-supplier=Conrad; ComponentLink4Description: https://datasheet.ciiva.com/41455/001015500-da-01-en-ic-binary-counter-cd4060bm96-soic-16-tid-41455418.pdf?src-supplier=Conrad
U3 = TS555IDTTR: IC OSC SINGLE TIMER 2.7MHZ 8SOIC; Manufacturer: STMicroelectronics; Max Supply Voltage: 16V; Min Supply Voltage: 2V; Number of Channels: 1NUMBER; Propagation Delay: 100ns; Supplier: Future Electronics; LCSC Part Number: C880084; Manufacturer Part Number: TS555IDTTR; RoHS: Yes; Item Type: IC; Stock: 50000; Pricing: 2500=0.36, 5000=0.355, 7500=0.35, 12500=0.345, 25000=0.335 (USD); Height: 1.75mm; ComponentLink1URL: http://www.farnell.com/datasheets/1947266.pdf?src-supplier=Farnell; ComponentLink1Description: http://www.farnell.com/datasheets/1947266.pdf?src-supplier=Farnell; ComponentLink2URL: http://www.farnell.com/datasheets/1947266.pdf?src-supplier=Element14; ComponentLink2Description: http://www.farnell.com/datasheets/1947266.pdf?src-supplier=Element14; ComponentLink3URL: http://www.farnell.com/datasheets/1947266.pdf?src-supplier=Newark; ComponentLink3Description: http://www.farnell.com/datasheets/1947266.pdf?src-supplier=Newark; ComponentLink4URL: http://www.st.com/content/ccc/resource/technical/document/datasheet/45/d5/c6/11/46/d3/4b/a3/CD00000893.pdf/files/CD00000893.pdf/jcr:content/translations/en.CD00000893.pdf?src-supplier=Digikey; ComponentLink4Description: http://www.st.com/content/ccc/resource/technical/document/datasheet/45/d5/c6/11/46/d3/4b/a3/CD00000893.pdf/files/CD00000893.pdf/jcr:content/translations/en.CD00000893.pdf?src-supplier=Digikey; ComponentLink5URL: http://www.st.com/st-web-ui/static/active/en/resource/technical/document/datasheet/CD00000893.pdf?src-supplier=Avnet; ComponentLink5Description: http://www.st.com/st-web-ui/static/active/en/resource/technical/document/datasheet/CD00000893.pdf?src-supplier=Avnet; ComponentLink6URL: https://datasheet.octopart.com/TS555IDTTR-STMicroelectronics-datasheet-45197658.pdf?src-supplier=TME; ComponentLink6Description: https://datasheet.octopart.com/TS555IDTTR-STMicroelectronics-datasheet-45197658.pdf?src-supplier=TME
U4 = ZXGD3002E6TA: IC GATE DRVR IGBT/MOSFET SOT23-6; Manufacturer: Diodes Zetex; Supplier: Future Electronics; LCSC Part Number: C156276; Manufacturer Part Number: ZXGD3002E6TA; RoHS: No; Item Type: IC; Stock: 48000; Pricing: 3000=0.275, 6000=0.265 (USD); ComponentLink1URL: https://datasheet.ciiva.com/1949/zxgd3002e6-1949760.pdf?src-supplier=Avnet; ComponentLink1Description: https://datasheet.ciiva.com/1949/zxgd3002e6-1949760.pdf?src-supplier=Avnet; ComponentLink2URL: https://datasheet.ciiva.com/1949/zxgd3002e6-1949760.pdf?src-supplier=Digikey; ComponentLink2Description: https://datasheet.ciiva.com/1949/zxgd3002e6-1949760.pdf?src-supplier=Digikey; ComponentLink3URL: https://datasheet.ciiva.com/16957/0900766b80e4f81f-16957288.pdf?src-supplier=Allied+Electronics; ComponentLink3Description: https://datasheet.ciiva.com/16957/0900766b80e4f81f-16957288.pdf?src-supplier=Allied+Electronics; ComponentLink4URL: https://datasheet.ciiva.com/6807/28818-6807237.pdf?src-supplier=Newark; ComponentLink4Description: https://datasheet.ciiva.com/6807/28818-6807237.pdf?src-supplier=Newark; ComponentLink5URL: https://datasheet.ciiva.com/7652/28818-7652871.pdf?src-supplier=Element14; ComponentLink5Description: https://datasheet.ciiva.com/7652/28818-7652871.pdf?src-supplier=Element14; ComponentLink6URL: https://datasheet.ciiva.com/3226/zxgd3002e6-3226748.pdf?src-supplier=Avnet; ComponentLink6Description: https://datasheet.ciiva.com/3226/zxgd3002e6-3226748.pdf?src-supplier=Avnet; ComponentLink7URL: https://datasheet.ciiva.com/1949/zxgd3002e6-1949761.pdf?src-supplier=Digikey; ComponentLink7Description: https://datasheet.ciiva.com/1949/zxgd3002e6-1949761.pdf?src-supplier=Digikey; ComponentLink8URL: https://datasheet.ciiva.com/1949/zxgd3002e6-1949762.pdf?src-supplier=Digikey; ComponentLink8Description: https://datasheet.ciiva.com/1949/zxgd3002e6-1949762.pdf?src-supplier=Digikey